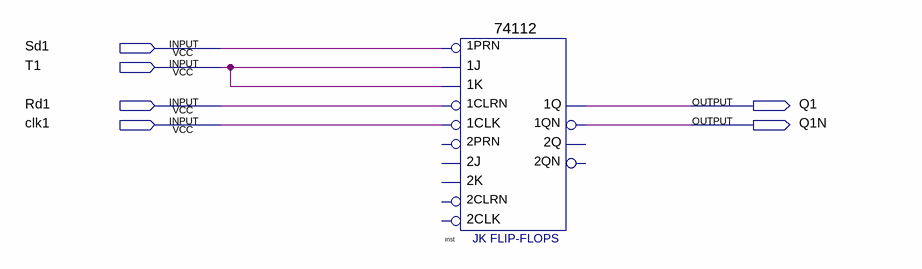
[diagram p0: schematic sheet]
// Quartus schematic exp5_t4_jk2t.bdf as structural Verilog: 1 symbols, 6 pins
module exp5_t4_jk2t (
  input  Sd1,
  input  T1,
  input  Rd1,
  input  clk1,
  output Q1,
  output Q1N
);

  \74112  inst (
    .\1K (T1), .\1J (T1), .\1PRN (Sd1), .\1CLK (clk1), .\1CLRN (Rd1), .\1QN (Q1N), .\1Q (Q1));  // open: 2K, 2J, 2PRN, 2CLK, 2CLRN, 2Q, 2QN
endmodule
